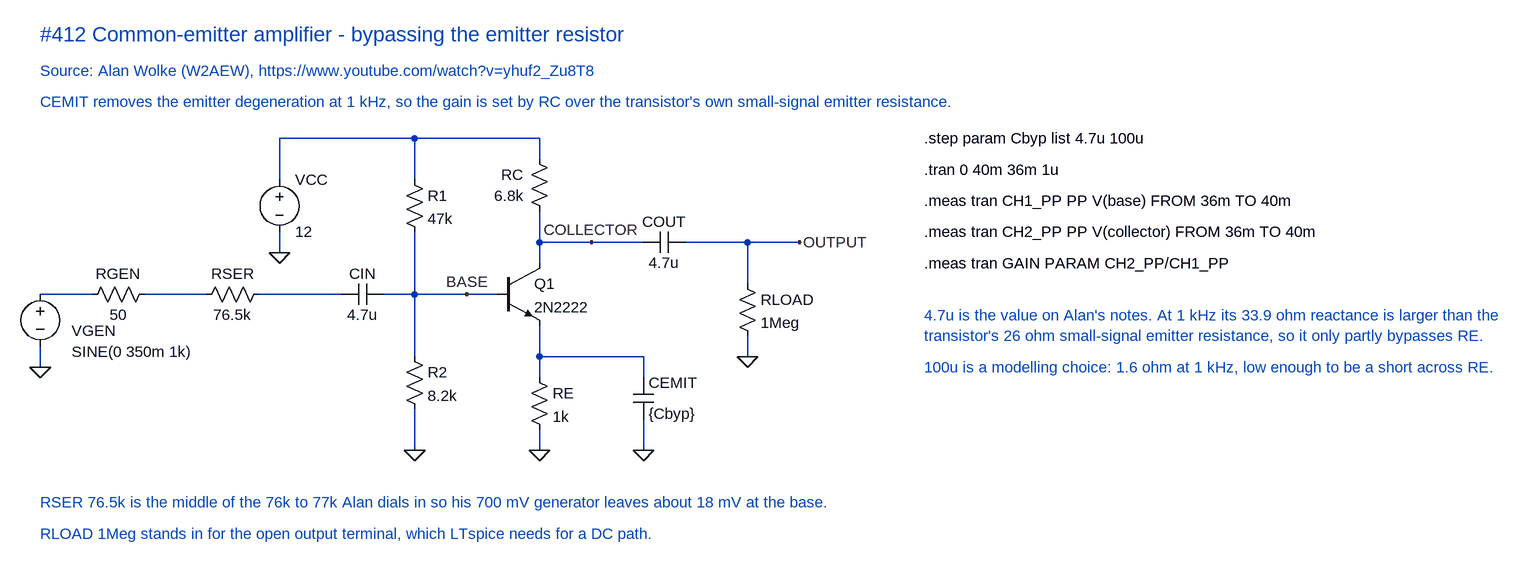
[diagram p0: schematic Emitter bypassed common emitter.asc]
Emitter bypassed common emitter.asc, the LTspice schematic file:
Version 4.1
SHEET 1 1600 1100
WIRE -416 112 -336 112
WIRE -256 112 -160 112
WIRE -80 112 48 112
WIRE 112 112 160 112
WIRE -416 192 -416 224
WIRE -48 -128 -48 -64
WIRE 160 -128 -48 -128
WIRE 352 -128 160 -128
WIRE 352 -96 352 -128
WIRE 160 -64 160 -128
WIRE -48 48 -48 16
WIRE 352 32 352 -16
WIRE 512 32 352 32
WIRE 352 64 352 32
WIRE 672 32 576 32
WIRE 752 32 672 32
WIRE 672 96 672 32
WIRE 160 112 160 16
WIRE 240 112 160 112
WIRE 288 112 240 112
WIRE 160 208 160 112
WIRE 352 208 352 160
WIRE 512 208 352 208
WIRE 352 240 352 208
WIRE 512 240 512 208
WIRE 512 352 512 304
WIRE 672 208 672 176
WIRE 160 352 160 288
WIRE 352 352 352 320
FLAG -416 224 0
FLAG -48 48 0
FLAG 160 352 0
FLAG 352 352 0
FLAG 672 208 0
FLAG 512 352 0
FLAG 240 112 BASE
FLAG 432 32 COLLECTOR
FLAG 752 32 OUTPUT
SYMBOL voltage -416 96 R0
WINDOW 0 48 72 Left 2
WINDOW 3 48 104 Left 2
SYMATTR InstName VGEN
SYMATTR Value SINE(0 350m 1k)
SYMBOL res -240 96 R90
WINDOW 0 0 56 VBottom 2
WINDOW 3 32 56 VTop 2
SYMATTR InstName RGEN
SYMATTR Value 50
SYMBOL res -64 96 R90
WINDOW 0 0 56 VBottom 2
WINDOW 3 32 56 VTop 2
SYMATTR InstName RSER
SYMATTR Value 76.5k
SYMBOL cap 112 96 R90
WINDOW 0 0 32 VBottom 2
WINDOW 3 32 32 VTop 2
SYMATTR InstName CIN
SYMATTR Value 4.7u
SYMBOL voltage -48 -80 R0
SYMATTR InstName VCC
SYMATTR Value 12
SYMBOL res 144 -80 R0
SYMATTR InstName R1
SYMATTR Value 47k
SYMBOL res 144 192 R0
SYMATTR InstName R2
SYMATTR Value 8.2k
SYMBOL res 336 -112 R0
WINDOW 0 -8 40 Right 2
WINDOW 3 -8 72 Right 2
SYMATTR InstName RC
SYMATTR Value 6.8k
SYMBOL npn 288 64 R0
SYMATTR InstName Q1
SYMATTR Value 2N2222
SYMBOL res 336 224 R0
SYMATTR InstName RE
SYMATTR Value 1k
SYMBOL cap 576 16 R90
WINDOW 0 0 32 VBottom 2
WINDOW 3 32 32 VTop 2
SYMATTR InstName COUT
SYMATTR Value 4.7u
SYMBOL res 656 80 R0
SYMATTR InstName RLOAD
SYMATTR Value 1Meg
SYMBOL cap 496 240 R0
SYMATTR InstName CEMIT
SYMATTR Value {Cbyp}
TEXT -416 -288 Left 3 ;#412 Common-emitter amplifier - bypassing the emitter resistor
TEXT -416 -232 Left 2 ;Source: Alan Wolke (W2AEW), https://www.youtube.com/watch?v=yhuf2_Zu8T8
TEXT -416 -184 Left 2 ;CEMIT removes the emitter degeneration at 1 kHz, so the gain is set by RC over the transistor's own small-signal emitter resistance.
TEXT 944 -128 Left 2 !.step param Cbyp list 4.7u 100u
TEXT 944 -80 Left 2 !.tran 0 40m 36m 1u
TEXT 944 -32 Left 2 !.meas tran CH1_PP PP V(base) FROM 36m TO 40m
TEXT 944 16 Left 2 !.meas tran CH2_PP PP V(collector) FROM 36m TO 40m
TEXT 944 64 Left 2 !.meas tran GAIN PARAM CH2_PP/CH1_PP
TEXT 944 144 Left 2 ;4.7u is the value on Alan's notes. At 1 kHz its 33.9 ohm reactance is larger than the
TEXT 944 176 Left 2 ;transistor's 26 ohm small-signal emitter resistance, so it only partly bypasses RE.
TEXT 944 224 Left 2 ;100u is a modelling choice: 1.6 ohm at 1 kHz, low enough to be a short across RE.
TEXT -416 432 Left 2 ;RSER 76.5k is the middle of the 76k to 77k Alan dials in so his 700 mV generator leaves about 18 mV at the base.
TEXT -416 480 Left 2 ;RLOAD 1Meg stands in for the open output terminal, which LTspice needs for a DC path.

The netlist it stands for:
* Emitter bypassed common emitter.asc
VGEN N001 0 SINE(0 350m 1k)
RGEN N002 N001 50
RSER N003 N002 76.5k
CIN BASE N003 4.7u
VCC N004 0 12
R1 N004 BASE 47k
R2 BASE 0 8.2k
RC N004 COLLECTOR 6.8k
Q1 COLLECTOR BASE N005 0 2N2222
RE N005 0 1k
COUT OUTPUT COLLECTOR 4.7u
RLOAD OUTPUT 0 1Meg
CEMIT N005 0 {Cbyp}
.model NPN NPN
.model PNP PNP
.lib standard.bjt
* #412 Common-emitter amplifier - bypassing the emitter resistor
* Source: Alan Wolke (W2AEW), https://www.youtube.com/watch?v=yhuf2_Zu8T8
* CEMIT removes the emitter degeneration at 1 kHz, so the gain is set by RC over the transistor's own small-signal emitter resistance.
.step param Cbyp list 4.7u 100u
.tran 0 40m 36m 1u
.meas tran CH1_PP PP V(base) FROM 36m TO 40m
.meas tran CH2_PP PP V(collector) FROM 36m TO 40m
.meas tran GAIN PARAM CH2_PP/CH1_PP
* 4.7u is the value on Alan's notes. At 1 kHz its 33.9 ohm reactance is larger than the
* transistor's 26 ohm small-signal emitter resistance, so it only partly bypasses RE.
* 100u is a modelling choice: 1.6 ohm at 1 kHz, low enough to be a short across RE.
* RSER 76.5k is the middle of the 76k to 77k Alan dials in so his 700 mV generator leaves about 18 mV at the base.
* RLOAD 1Meg stands in for the open output terminal, which LTspice needs for a DC path.
.backanno
.end